# Altium schematic sheet Receiving.SchDoc: Sample Sheet Title
size B; Date: MM/DD/YYYY; Author: Sample Author; Organization: ORGANIZATION; Address1: ADDRESS 1; Address2: ADDRESS 2; Address3: ADDRESS 3; Address4: ADDRESS 4; Revision: -; SheetNumber: 3; SheetTotal: 6; ENG_APP_DATE: --/--/--; DSN_APP_DATE: --/--/--; CHK_APP_DATE: --/--/--
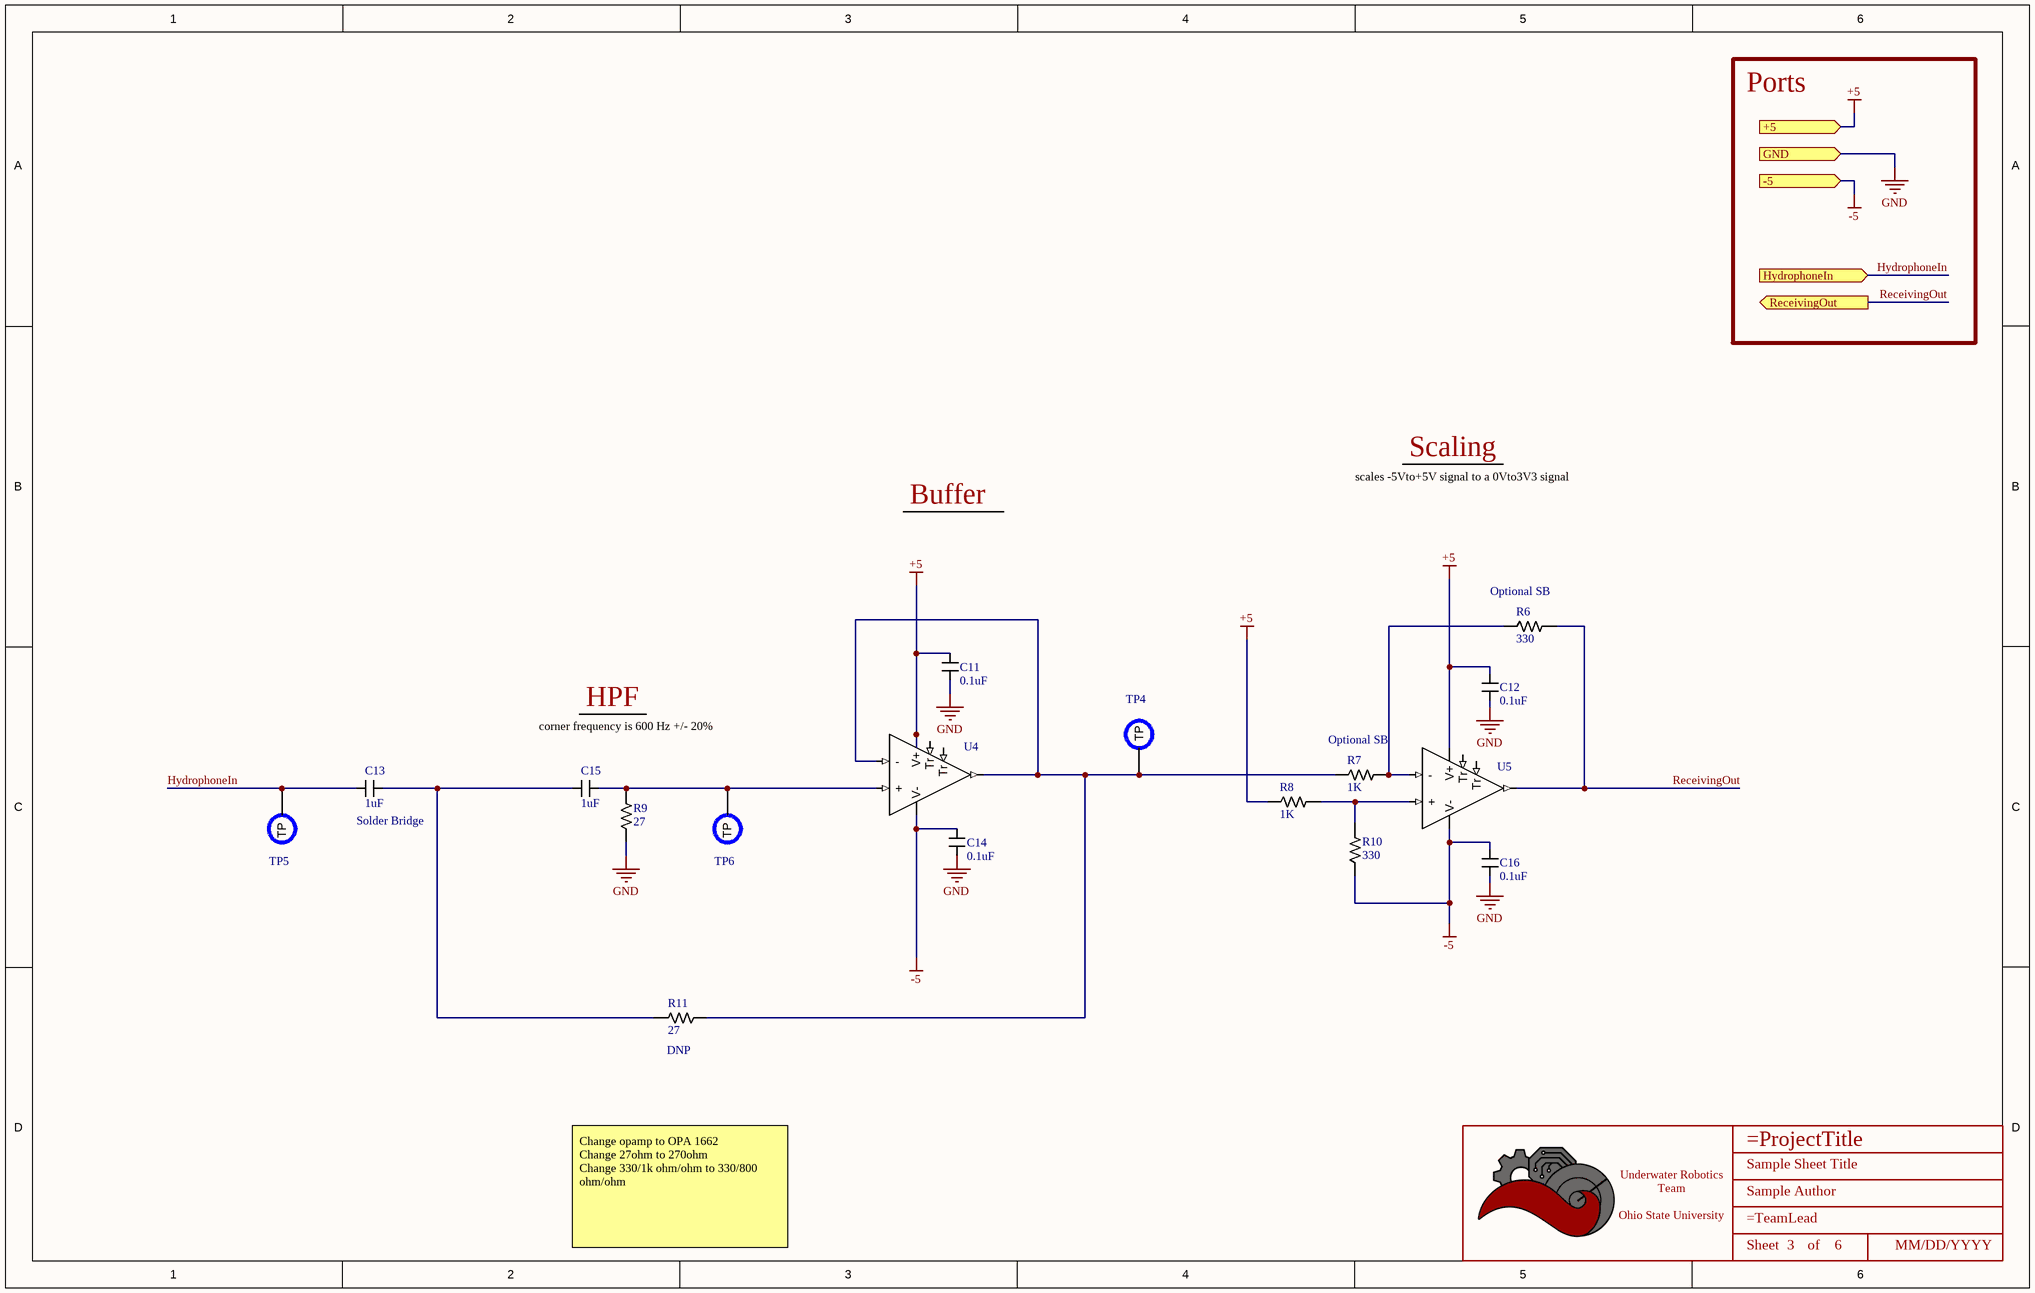
[diagram p0: Receiving.SchDoc]

## Parts
*  Title_Block  [LOGO]  (value not drawn)  (graphical)
C11  value 0.1uF  [CAPACITOR_0603]  (hidden comment: 100nF Ceramic 6.3V)
C12  value 0.1uF  [CAPACITOR_0603]  (hidden comment: 100nF Ceramic 6.3V)
C13  value 1uF  [CAPACITOR_0603]  (hidden comment: 1uF Ceramic 16V)
C14  value 0.1uF  [CAPACITOR_0603]  (hidden comment: 100nF Ceramic 6.3V)
C15  value 1uF  [CAPACITOR_0603]  (hidden comment: 1uF Ceramic 16V)
C16  value 0.1uF  [CAPACITOR_0603]  (hidden comment: 100nF Ceramic 6.3V)
R6  Value  (Ohms): 330  [RESISTOR_0603]  (hidden comment: 330 Ohm 1% 1/10W)
R7  Value  (Ohms): 1K  [RESISTOR_0603]  (hidden comment: 1k Ohm 5% 1/10W)
R8  Value  (Ohms): 1K  [RESISTOR_0603]  (hidden comment: 1k Ohm 5% 1/10W)
R9  Value  (Ohms): 27  [RESISTOR_0402]  (hidden comment: 27 Ohm 1% 1/16W)
R10  Value  (Ohms): 330  [RESISTOR_0603]  (hidden comment: 330 Ohm 1% 1/10W)
R11  Value  (Ohms): 27  [RESISTOR_0402]  (hidden comment: 27 Ohm 1% 1/16W)
TP4  PCB Test Point  [TESTPOINT_1.2MM]  (value not drawn)  (no BOM)
TP5  PCB Test Point  [TESTPOINT_1.2MM]  (value not drawn)  (no BOM)
TP6  PCB Test Point  [TESTPOINT_1.2MM]  (value not drawn)  (no BOM)
U4  IC OPAMP GP 1 CIRCUIT 8SOIC  [SOIC-8]  (value not drawn)
U5  IC OPAMP GP 1 CIRCUIT 8SOIC  [SOIC-8]  (value not drawn)

## Ports
+5 (in), -5 (in), GND (in), HydrophoneIn (in), ReceivingOut (out)

## Nets
+5: C11.1 C12.1 R8.2 U4.7(V+) U5.7(V+) ; port +5
-5: C14.1 C16.1 R10.2 U4.4(V-) U5.4(V-) ; port -5
GND: C11.2 C12.2 C14.2 C16.2 R9.2 ; port GND
HydrophoneIn: C13.2 TP5.TP ; port HydrophoneIn
ReceivingOut: R6.1 U5.6(Output) ; port ReceivingOut
NetC13_1: C13.1 C15.2 R11.1
NetC15_1: C15.1 R9.1 TP6.TP U4.3(+)
NetR6_2: R6.2 R7.1 U5.2(-)
NetR7_2: R7.2 R11.2 TP4.TP U4.2(-) U4.6(Output)
NetR8_1: R8.1 R10.1 U5.3(+)

Not connected (* = marked no-connect by the designer): U4 1(Tr) 8(Tr); U5 1(Tr) 8(Tr)

## Notes on the sheet
- Ports
- Buffer
- scales -5Vto+5V signal to a 0Vto3V3 signal
- Scaling
- (near R6) Optional SB
- corner frequency is 600 Hz +/- 20%
- HPF
- Optional SB
- (near C13) Solder Bridge
- (near R11) DNP
- Change opamp to OPA 1662
  Change 27ohm to 270ohm
  Change 330/1k ohm/ohm to 330/800 ohm/ohm
- DWG. NO.
- REV.
- SHT.
- THIS DOCUMENT AND THE DATA DISCLOSED HEREIN OR HEREWITH IS THE PROPERTY OF ALTIUM LIMITED AND MAY BE FREELY DISTRIBUTED IN WHOLE. NO RIGHTS ARE RESERVED OR EXPRESS OR IMPLIED WARANTEE GIVEN.
- REVISION
- DESCRIPTION
- DATE
- APPROVED
- ENG:
- APPROVALS
- PROJECT
- DSN:
- CHK:
- REFERENCE DOCUMENTS
- PROJECT REVISION:
- TITLE
- DOCUMENT REVISION:
- DESIGN ITEM:
- BOM:
- FAB DWG:
- PCB DWG:
- ASSY DWG:
- SCALE:
- SIZE
- B
- CAGE CODE
- FILE NAME
- DWG NO.
- SHEET
- OF
- REV
- (in symbol Title_Block) Underwater Robotics Team / Ohio State University; Sheet; of

## Library data of the parts
* = Title_Block: UWRT Schematic Title Block Template / Created June 2021, Dylan Trainor
C11 C12 C14 C16 = CAPACITOR_0.1uF_0603: Cap 100nF 6.3V +/-10% / Ceramic 0603; Made By: Flip B; ComponentLink1Description: Datsheet; ComponentLink1URL: https://www.mouser.com/datasheet/2/212/KEM_C1002_X7R_SMD-1102033.pdf; Tolerance: +/- 10%; Voltage: 6.3V; Supplier 1: Digi-Key; Supplier Part Number 1: 399-15351-1-ND
C13 C15 = CAPACITOR_1uF_0603: Cap 1uF 16V +/-10% / Ceramic 0603; Made By: Flip B; Tolerance: +/- 10%; Voltage: 16V; Supplier 1: Arrow Electronics; Supplier Part Number 1: C1608X7R1C105K080AC
R6 R10 = RESISTOR_330_0603: RES 330 OHM 1% 1/10W 0603; Tolerance: +/- 1%; Made By: Robert Pafford; Wattage: 1/10W; Supplier 1: Digi-Key; Supplier Part Number 1: P330HCT-ND
R7 R8 = RESISTOR_1K_0.5%_0603: RES 1k OHM 0.5% 1/10W 0603; Tolerance: +/- 0.5%; Made By: Robert Pafford; Wattage: 1/10W; Supplier: Digikey; Digikey Part Numer: CR0603-JW-104ELFTR-ND; Supplier 1: Digi-Key; Supplier Part Number 1: 749-1693-1-ND
R9 R11 = RESISTOR_27_0402: RES 27 OHM 1% 1/16W 0402; Tolerance: +/- 1%; Made By: Robert Pafford; Wattage: 1/16W; Supplier: Digikey; Digikey Part Numer: CR0603-JW-104ELFTR-ND; Supplier 1: Digi-Key; Supplier Part Number 1: YAG5278DKR-ND
TP4-TP6 = TESTPOINT: Made By: Robert Pafford
U4 U5 = OPA228U: General Purpose Amplifier 1 Circuit 8-SOIC